# Altium schematic sheet UM78M_12_8V.SchDoc
size A4
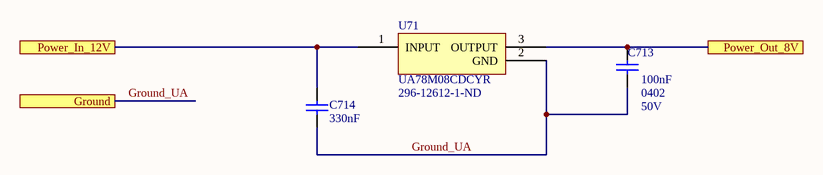
[diagram p0: UM78M_12_8V.SchDoc]

## Parts
C713  100nF  Case Code (Imperial): 0402  Voltage: 50V  [CAP 0402/1005 KK]
C714  330nF  [CAP 0603/1608 RF]
U71  UA78M08CDCYR  Supplier Part Number 1: 296-12612-1-ND  [UA78M]

## Ports
Ground, Power_In_12V, Power_Out_8V

## Nets
Ground_UA: C713.1 C714.1 U71.2(GND) ; port Ground
Power_In_12V: C714.2 U71.1(INPUT) ; port Power_In_12V
Power_Out_8V: C713.2 U71.3(OUTPUT) ; port Power_Out_8V

## Library data of the parts
C713 = Capacitor: CAP CER 0.1UF 50V X5R 0402; Manufacturer: Murata; Manufacturer Part Number: GRM155R61H104KE14D; Dielectric Material: Ceramic; Dissipation Factor: 0.025%; Tolerance: 10%; Supplier 1: Digi-Key; Supplier Part Number 1: 490-10697-1-ND; RoHS: Yes; Category: Ceramic Capacitors; Stock 1: 435607; Pricing 1: 1=0,10000, 10=0,04600, 100=0,02050, 500=0,01464, 1000=0,01150, 2500=0,01045, 5000=0,00961 (USD); Mount: Surface Mount; Case/Package: 0402; Weight: 0.000212oz; Case Code (Metric): 1005; Min Operating Temperature: -55°C; Max Operating Temperature: 85°C; Capacitance: 100nF; Packaging: Tape and Reel; Voltage Rating: 50V; Dielectric: X5R; Termination: SMD/SMT; Composition: Ceramic; Voltage Rating (DC): 50V; Package Quantity: 10000; Length: 1mm; Height: 0.5mm; Width: 0.02inch; Thickness: 0.022inch; Depth: 0.5mm; REACH SVHC: No SVHC; Lead Free: Lead Free; ComponentLink1URL: http://www.farnell.com/datasheets/2079150.pdf?src-supplier=Farnell; ComponentLink1Description: http://www.farnell.com/datasheets/2079150.pdf?src-supplier=Farnell; ComponentLink2URL: http://www.mouser.com/ds/2/281/c02e-2905.pdf?src-supplier=Mouser; ComponentLink2Description: http://www.mouser.com/ds/2/281/c02e-2905.pdf?src-supplier=Mouser; ComponentLink3URL: http://www.farnell.com/datasheets/2079150.pdf?src-supplier=Element14; ComponentLink3Description: http://www.farnell.com/datasheets/2079150.pdf?src-supplier=Element14; ComponentLink4URL: http://search.murata.co.jp/Ceramy/image/img/A01X/G101/ENG/GRM155R61H104KE14-01.pdf?src-supplier=Digi-Key; ComponentLink4Description: http://search.murata.co.jp/Ceramy/image/img/A01X/G101/ENG/GRM155R61H104KE14-01.pdf?src-supplier=Digi-Key
C714 = Capacitor: CAP CER 0.33UF 25V Y5V 0603; Manufacturer: KEMET; Manufacturer Part Number: C0603C334Z3VACTU; Dielectric Material: Ceramic; Tolerance: 80%; Dissipation Factor: 7%; Supplier 1: Digi-Key; Supplier Part Number 1: 399-1292-1-ND; RoHS: Yes; Category: Ceramic Capacitors; Stock 1: 11797; Pricing 1: 1=0,35000, 10=0,24500, 100=0,14720, 500=0,11044, 1000=0,09326 (USD); Mount: Surface Mount,PCB; Case/Package: 0603; Number of Pins: 2; Case Code (Metric): 1608; Case Code (Imperial): 0603; Min Operating Temperature: -30°C; Max Operating Temperature: 85°C; Capacitance: 330nF; Voltage Rating: 25V; Packaging: Tape and Reel; Voltage Rating (DC): 25V; Package Quantity: 1; Dielectric: Y5V; Termination: SMD/SMT; Length: 1.6mm; Height: 0.8mm; Width: 0.031inch; Thickness: 0.035inch; Lead Pitch: 0.7mm; Depth: 0.8mm; Radiation Hardening: No; REACH SVHC: No SVHC; Lead Free: Lead Free; ComponentLink1URL: https://datasheet.ciiva.com/7378/1470417-7378528.pdf?src-supplier=Newark; ComponentLink1Description: https://datasheet.ciiva.com/7378/1470417-7378528.pdf?src-supplier=Newark; ComponentLink2URL: https://datasheet.ciiva.com/18193/getdatasheetpartid-220793-18193020.pdf?src-supplier=Verical; ComponentLink2Description: https://datasheet.ciiva.com/18193/getdatasheetpartid-220793-18193020.pdf?src-supplier=Verical
U71 = UA78M08CDCYR: IC REG LINEAR 8V 500MA SOT223-4; Manufacturer: Texas Instruments; Dropout Voltage: 2V; Number of Outputs: 1; Max Input Voltage: 25V; Min Input Voltage: 10.5V; Polarity: Positive; Power Supply Rejection Ratio (PSRR): 80dB; Quiescent Current: 4.6mA; Output Type: Fixed; Supplier 1: Digi-Key; Manufacturer Part Number: UA78M08CDCYR; RoHS: Yes; Category: Voltage Regulators - Linear; Stock 1: 16238; Pricing 1: 1=0,60000, 10=0,52700, 25=0,49480, 100=0,37520, 250=0,31932, 500=0,30334, 1000=0,23149 (USD); Mount: Surface Mount; Case/Package: SOT-223-4; Number of Pins: 4; Min Operating Temperature: -40°C; Max Operating Temperature: 125°C; Output Current: 500mA; Package Quantity: 1; Packaging: Tape and Reel; Output Voltage: 8V; Max Output Current: 500mA; Nominal Output Voltage: 8V; Number of Regulators: 1; Radiation Hardening: No; REACH SVHC: No SVHC; Lead Free: Lead Free; ComponentLink1URL: https://datasheet.ciiva.com/2042/ua78m05-2042195.pdf?src-supplier=Digi-Key; ComponentLink1Description: https://datasheet.ciiva.com/2042/ua78m05-2042195.pdf?src-supplier=Digi-Key; ComponentLink2URL: https://datasheet.ciiva.com/2042/ua78m05-2042196.pdf?src-supplier=Digi-Key; ComponentLink2Description: https://datasheet.ciiva.com/2042/ua78m05-2042196.pdf?src-supplier=Digi-Key; ComponentLink3URL: https://datasheet.ciiva.com/2042/ua78m05-2042197.pdf?src-supplier=Digi-Key; ComponentLink3Description: https://datasheet.ciiva.com/2042/ua78m05-2042197.pdf?src-supplier=Digi-Key; ComponentLink4URL: https://datasheet.ciiva.com/7992/1882046-7992585.pdf?src-supplier=Element14; ComponentLink4Description: https://datasheet.ciiva.com/7992/1882046-7992585.pdf?src-supplier=Element14